# Altium project OmniCore_SDR.PrjPcb (part 2 of 3)

## Sheet JTAG.SchDoc
size A4; SheetNumber: 6; SheetTotal: 11
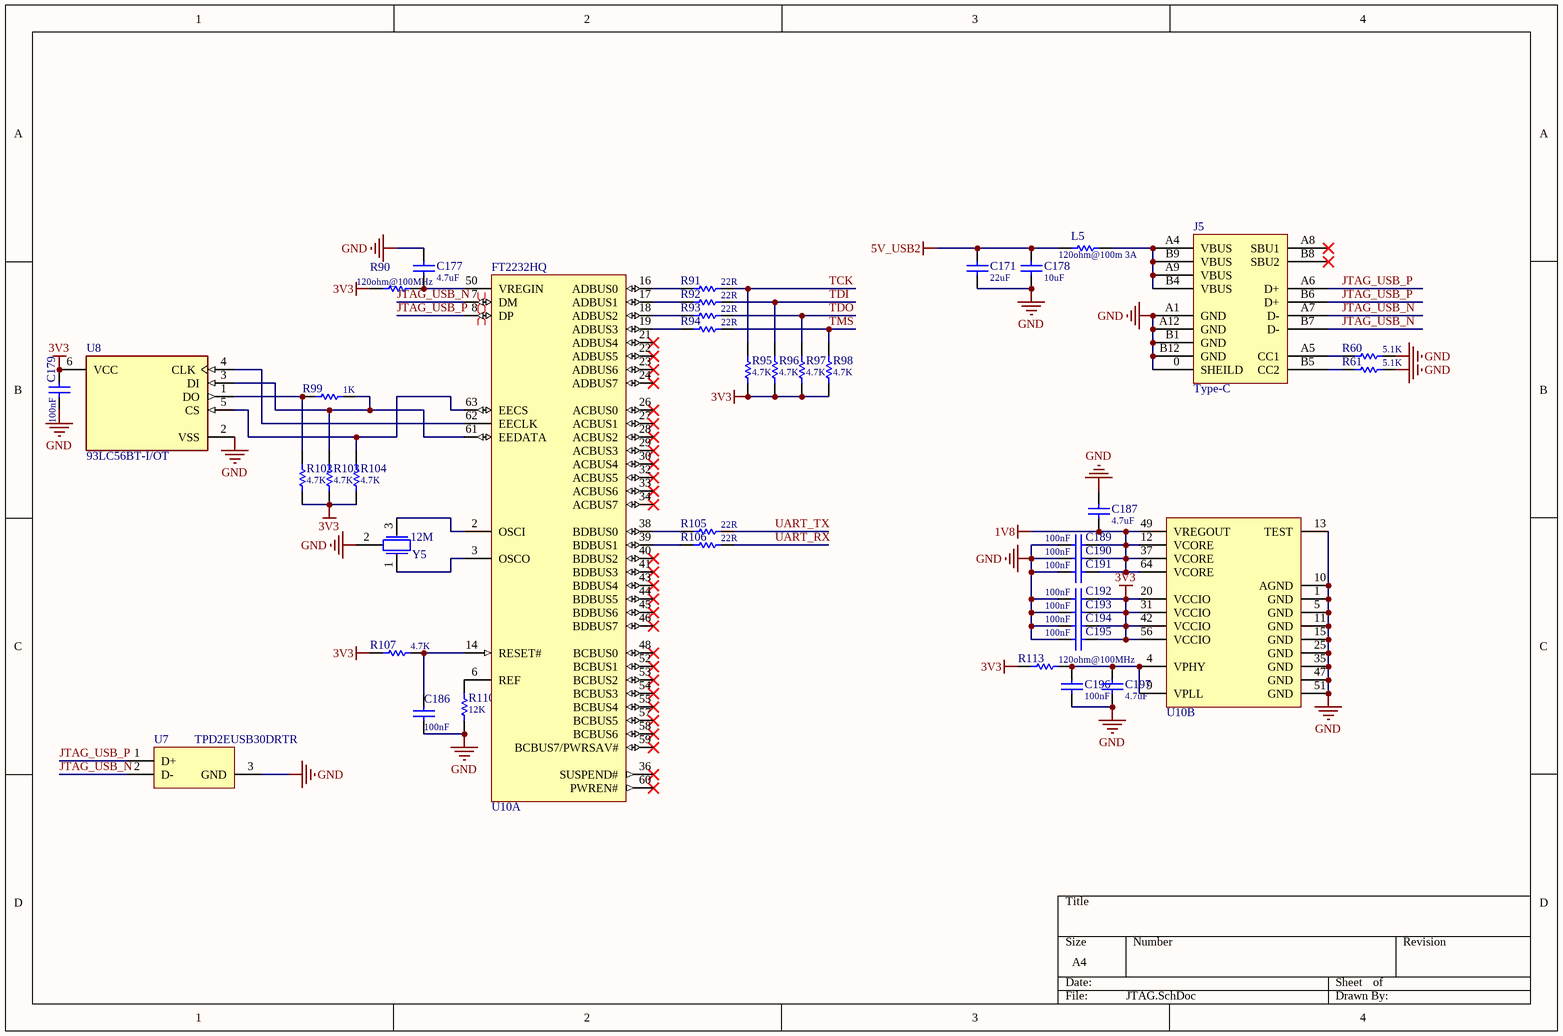
[diagram p5: JTAG.SchDoc]

### Parts
C171  value 22uF  [C0805-L]  (hidden comment: Cap-S)
C177  value 4.7uF  [C0402-L]  (hidden comment: Cap-S)
C178  value 10uF  [C0603-L]  (hidden comment: Cap-S)
C179  value 100nF  [C0402-L]  (hidden comment: Cap-S)
C186  value 100nF  [C0402-L]  (hidden comment: Cap-S)
C187  value 4.7uF  [C0402-L]  (hidden comment: Cap-S)
C189  value 100nF  [C0402-L]  (hidden comment: Cap-S)
C190  value 100nF  [C0402-L]  (hidden comment: Cap-S)
C191  value 100nF  [C0402-L]  (hidden comment: Cap-S)
C192  value 100nF  [C0402-L]  (hidden comment: Cap-S)
C193  value 100nF  [C0402-L]  (hidden comment: Cap-S)
C194  value 100nF  [C0402-L]  (hidden comment: Cap-S)
C195  value 100nF  [C0402-L]  (hidden comment: Cap-S)
C196  value 100nF  [C0402-L]  (hidden comment: Cap-S)
C197  value 4.7uF  [C0402-L]  (hidden comment: Cap-S)
J5  Type-C  [TYPE-C]
L5  value 120ohm@100m 3A  [R0805-L]  (hidden comment: R)
R60  value 5.1K  [R0402-L]  (hidden comment: R)
R61  value 5.1K  [R0402-L]  (hidden comment: R)
R90  value 120ohm@100MHz  [R0402-L]  (hidden comment: R)
R91  value 22R  [R0402-L]  (hidden comment: R)
R92  value 22R  [R0402-L]  (hidden comment: R)
R93  value 22R  [R0402-L]  (hidden comment: R)
R94  value 22R  [R0402-L]  (hidden comment: R)
R95  value 4.7K  [R0402-L]  (hidden comment: R)
R96  value 4.7K  [R0402-L]  (hidden comment: R)
R97  value 4.7K  [R0402-L]  (hidden comment: R)
R98  value 4.7K  [R0402-L]  (hidden comment: R)
R99  value 1K  [R0402-L]  (hidden comment: R)
R102  value 4.7K  [R0402-L]  (hidden comment: R)
R103  value 4.7K  [R0402-L]  (hidden comment: R)
R104  value 4.7K  [R0402-L]  (hidden comment: R)
R105  value 22R  [R0402-L]  (hidden comment: R)
R106  value 22R  [R0402-L]  (hidden comment: R)
R107  value 4.7K  [R0402-L]  (hidden comment: R)
R110  value 12K  [R0402-L]  (hidden comment: R)
R113  value 120ohm@100MHz  [R0402-L]  (hidden comment: R)
U7  TPD2EUSB30DRTR  [DRT0003A]
U8  93LC56BT-I/OT  [FP-C04-028-MFG]
U10  FT2232HQ  [QFN50P900X900X90-65N-D]  (parts A,B of 2)
Y5  12M  [XTAL-3Pin]

### Nets
1V8: C187.2 C189.2 C190.2 C191.2 U10.12(VCORE) U10.37(VCORE) U10.49(VREGOUT) U10.64(VCORE)
3V3: C179.2 C192.2 C193.2 C194.2 C195.2 R90.2 R95.2 R96.2 R97.2 R98.2 R102.2 R103.2 R104.2 R107.2 R113.2 U8.6(VCC) U10.20(VCCIO) U10.31(VCCIO) U10.42(VCCIO) U10.56(VCCIO)
5V_USB2: C171.1 C178.1 L5.1
GND: C171.2 C177.1 C178.2 C179.1 C186.1 C187.1 C189.1 C190.1 C191.1 C192.1 C193.1 C194.1 C195.1 C196.1 C197.2 J5.0(SHEILD) J5.A1(GND) J5.A12(GND) J5.B1(GND) J5.B12(GND) R60.1 R61.1 R110.1 U7.3(GND) U8.2(VSS) U10.1(GND) U10.5(GND) U10.10(AGND) U10.11(GND) U10.13(TEST) U10.15(GND) U10.25(GND) U10.35(GND) U10.47(GND) U10.51(GND) Y5.2
JTAG_USB_N: J5.A7(D-) J5.B7(D-) U7.2(D-) U10.7(DM)
JTAG_USB_P: J5.A6(D+) J5.B6(D+) U7.1(D+) U10.8(DP)
TCK: R91.1 R95.1
TDI: R92.1 R96.1
TDO: R93.1 R97.1
TMS: R94.1 R98.1
UART_RX: R106.1
UART_TX: R105.1
NetC177_2: C177.2 R90.1 U10.50(VREGIN)
NetC186_2: C186.2 R107.1 U10.14(RESET#)
NetC196_2: C196.2 C197.1 R113.1 U10.4(VPHY) U10.9(VPLL)
NetJ5_A4: J5.A4(VBUS) J5.A9(VBUS) J5.B4(VBUS) J5.B9(VBUS) L5.2
NetJ5_A5: J5.A5(CC1) R60.2
NetJ5_B5: J5.B5(CC2) R61.2
NetR91_2: R91.2 U10.16(ADBUS0)
NetR92_2: R92.2 U10.17(ADBUS1)
NetR93_2: R93.2 U10.18(ADBUS2)
NetR94_2: R94.2 U10.19(ADBUS3)
NetR99_1: R99.1 R103.1 U8.3(DI) U10.61(EEDATA)
NetR99_2: R99.2 R102.1 U8.1(DO)
NetR104_1: R104.1 U8.5(CS) U10.63(EECS)
NetR105_2: R105.2 U10.38(BDBUS0)
NetR106_2: R106.2 U10.39(BDBUS1)
NetR110_2: R110.2 U10.6(REF)
NetU8_4: U8.4(CLK) U10.62(EECLK)
NetU10_2: U10.2(OSCI) Y5.3
NetU10_3: U10.3(OSCO) Y5.1

Not connected (* = marked no-connect by the designer): J5 A8(SBU1)* B8(SBU2)*; U10 21(ADBUS4)* 22(ADBUS5)* 23(ADBUS6)* 24(ADBUS7)* 26(ACBUS0)* 27(ACBUS1)* 28(ACBUS2)* 29(ACBUS3)* 30(ACBUS4)* 32(ACBUS5)* 33(ACBUS6)* 34(ACBUS7)* 36(SUSPEND#)* 40(BDBUS2)* 41(BDBUS3)* 43(BDBUS4)* 44(BDBUS5)* 45(BDBUS6)* 46(BDBUS7)* 48(BCBUS0)* 52(BCBUS1)* 53(BCBUS2)* 54(BCBUS3)* 55(BCBUS4)* 57(BCBUS5)* 58(BCBUS6)* 59(BCBUS7/PWRSAV#)* 60(PWREN#)*

### Layout directives
differential pair: JTAG_USB_N, JTAG_USB_P

### Library data of the parts
C171 C177-C179 C186 C187 C189-C197 = Cap-S: 贴片瓷片电容
L5 R60 R61 R90-R99 R102-R107 R110 R113 = Res: 贴片电阻
U7 = CMP-0326-00046-3: ESD Solution for Super-Speed (6 Gbps) USB 3.0 Interface, 2 Channels, -40 to +85 degC, 3-pin SOT (DRT), Green (Rohs & No Sb/Br); Manufacturer: Texas Instruments; Differential Capacitance(pF): 0.01; Breakdown Voltage(Min)(V): 9; HDMI: TRUE; IEC 61000-4-2 Air-Gap(+/- kV): 8; IO Leakage Current(nA): 10; IO Capacitance(Typ)(pF): 0.7; Mounting Technology: Surface Mount; PackageDescription: 3-Flat Lead Plastic Small Outline, 1 x 1 mm (inc leads), 0.35 mm Pitch; IEC 61000-4-2 Contact(+/- kV): 8; USB Super Speed: TRUE; Eco-Plan: Green (RoHS & no Sb/Br); USB High Speed: TRUE; PackageReference: DRT0003A; SubFamily: ESD Solution; USB Full Speed: TRUE; ComponentLink1Description: Datasheet; ComponentLink2URL: SamplesURL:http://www.ti.com/product/tpd2eusb30#samples; PackageVersion: revD, Jun-2008; ComponentLink2Description: URL Link1; 1394 / Firewire: TRUE; PartNumber: TPD2EUSB30DRTR; ComponentLink1URL: http://www.ti.com/general/docs/lit/getliterature.tsp?genericPartNumber=TPD2EUSB30&fileType=pdf; DatasheetVersion: SLVSAC2C; Serial ATA / eSATA: TRUE
U8 = CMP-0162-00356-2: IC EEPROM 2K SPI 2MHZ SOT23-6; Access Time: 250ns; Density: 2Kb; Max Supply Voltage: 5.5V; Interface: Serial; Min Supply Voltage: 2.5V; Nominal Supply Current: 2mA; Number of Pins: 6; Radiation Hardening: No; Length: 3.1mm; Height: 1.3mm; Min Operating Temperature: -40°C; Max Operating Temperature: 85°C; Lead Free: Lead Free; Memory Type: EEPROM; Contact Plating: Tin; REACH SVHC: No SVHC; Package Quantity: 3000; Frequency: 2MHz; Width: 1.8mm; Max Frequency: 2MHz; Case/Package: SOT-23; Mount: Surface Mount; Packaging: Tape and Reel; Memory Size: 2Kb
U10 = FT2232HQ: Dual High Speed USB to Multipurpose UART / FIFO IC / , 3 to 3.6 V, -40 to 85 degC, 64- Pin LQFP, RoHS; Manufacturer: FTDI; Number of Channels per Chip: 2; Standard Supported: RS232,RS422,RS485; Maximum Data Rate: 480Mbit/s; Package Description: 64-Pin Low-profile Quad Flat Package, Body 10 x 10 mm, Pitch 0.5 mm; Maximum Operating Temperature: +85°C; Mounting Technology: SurfaceMount; Pin Count: 64; Package Reference: LQFP-64; Manufacturer URL: http://www.nxp.com/; Length: 10mm; Width: 10mm; Minimum Operating Temperature: -40°C; Dimensions: 10x10x1.4mm; Package Type: LQFP; Mounting Type: SurfaceMount; Datasheet URL: http://www.ftdichip.com/Support/Documents/DataSheets/ICs/DS_FT2232H.pdf; Datasheet Version: Rev. 2.5, 07/2016; Height: 1.4mm
Y5 = XTAL-3PIN: 贴片晶振

## Sheet AD9361.SchDoc
size A4; SheetNumber: 7; SheetTotal: 11
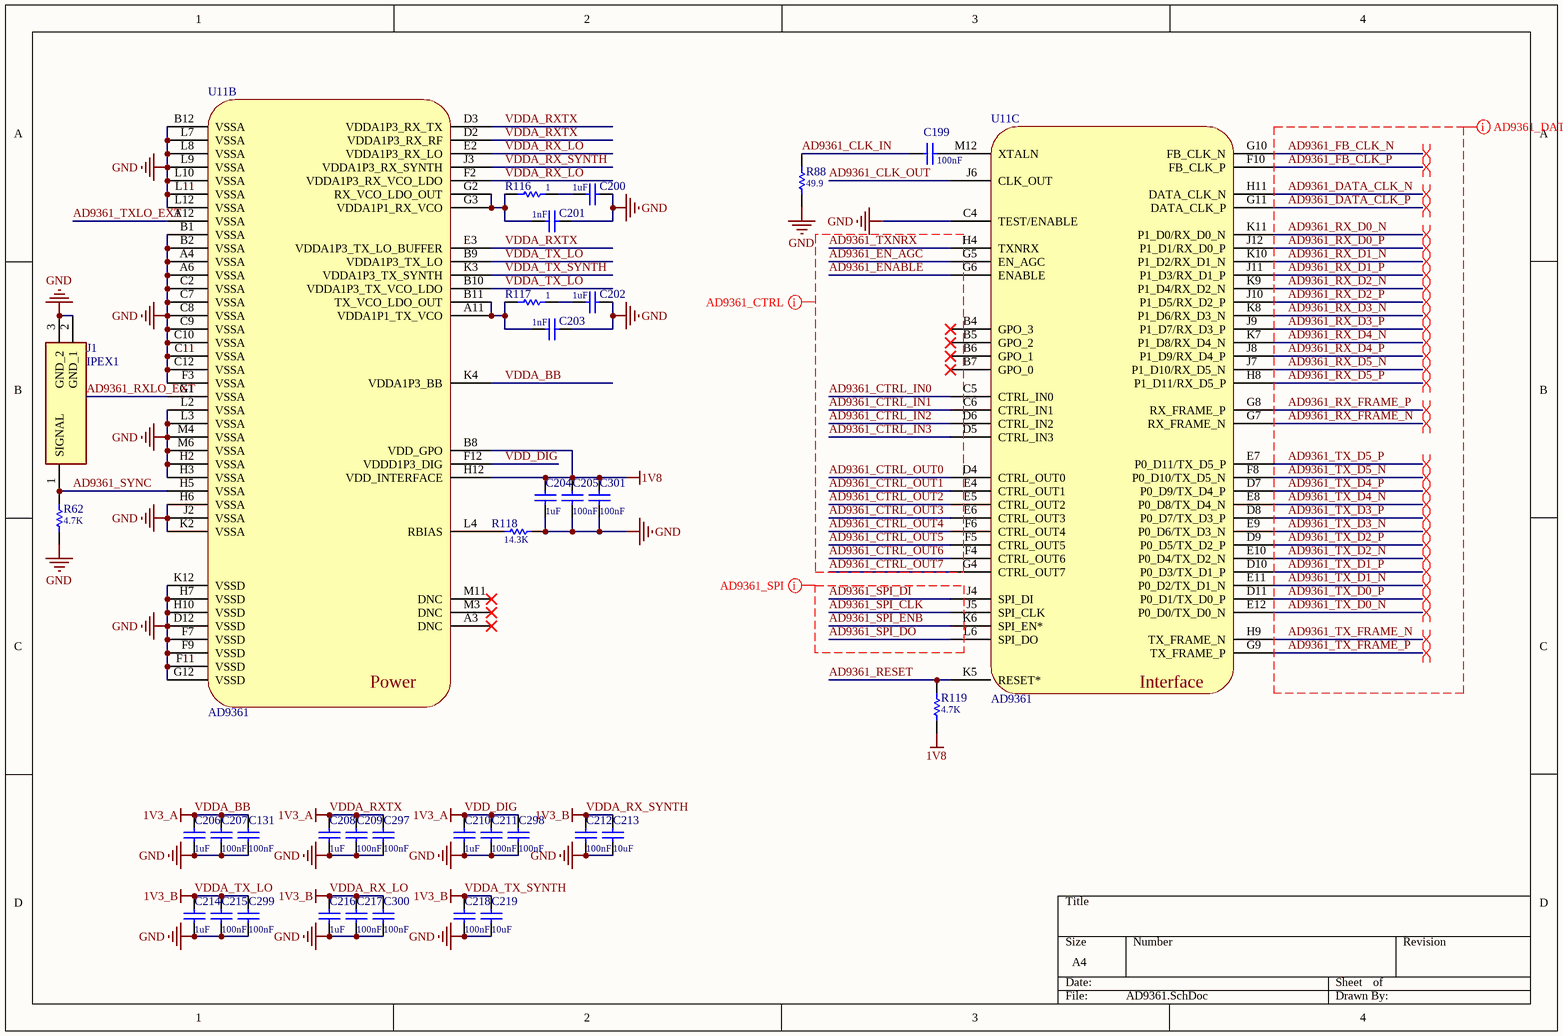
[diagram p6: AD9361.SchDoc]

### Parts
C131  value 100nF  [C0402-L]  (hidden comment: Cap-S)
C199  value 100nF  [C0402-L]  (hidden comment: Cap-S)
C200  value 1uF  [C0402-L]  (hidden comment: Cap-S)
C201  value 1nF  [C0402-L]  (hidden comment: Cap-S)
C202  value 1uF  [C0402-L]  (hidden comment: Cap-S)
C203  value 1nF  [C0402-L]  (hidden comment: Cap-S)
C204  value 1uF  [C0402-L]  (hidden comment: Cap-S)
C205  value 100nF  [C0402-L]  (hidden comment: Cap-S)
C206  value 1uF  [C0402-L]  (hidden comment: Cap-S)
C207  value 100nF  [C0402-L]  (hidden comment: Cap-S)
C208  value 1uF  [C0402-L]  (hidden comment: Cap-S)
C209  value 100nF  [C0402-L]  (hidden comment: Cap-S)
C210  value 1uF  [C0402-L]  (hidden comment: Cap-S)
C211  value 100nF  [C0402-L]  (hidden comment: Cap-S)
C212  value 100nF  [C0402-L]  (hidden comment: Cap-S)
C213  value 10uF  [C0603-L]  (hidden comment: Cap-S)
C214  value 1uF  [C0402-L]  (hidden comment: Cap-S)
C215  value 100nF  [C0402-L]  (hidden comment: Cap-S)
C216  value 1uF  [C0402-L]  (hidden comment: Cap-S)
C217  value 100nF  [C0402-L]  (hidden comment: Cap-S)
C218  value 100nF  [C0402-L]  (hidden comment: Cap-S)
C219  value 10uF  [C0603-L]  (hidden comment: Cap-S)
C297  value 100nF  [C0402-L]  (hidden comment: Cap-S)
C298  value 100nF  [C0402-L]  (hidden comment: Cap-S)
C299  value 100nF  [C0402-L]  (hidden comment: Cap-S)
C300  value 100nF  [C0402-L]  (hidden comment: Cap-S)
C301  value 100nF  [C0402-L]  (hidden comment: Cap-S)
J1  IPEX1  [20279-001E]
R62  value 4.7K  [R0402-L]  (hidden comment: R)
R88  value 49.9  [R0402-L]  (hidden comment: R)
R116  value 1  [R0402-L]  (hidden comment: R)
R117  value 1  [R0402-L]  (hidden comment: R)
R118  value 14.3K  [R0402-L]  (hidden comment: R)
R119  value 4.7K  [R0402-L]  (hidden comment: R)
U11  AD9361  [BGA144C80P12X12_1000X1000X170]  (parts B,C of 3)

### Nets
1V8: C204.2 C205.2 C301.2 R119.2 U11.B8(VDD_GPO) U11.H12(VDD_INTERFACE)
GND: C131.1 C200.1 C201.1 C202.1 C203.1 C204.1 C205.1 C206.1 C207.1 C208.1 C209.1 C210.1 C211.1 C212.1 C213.1 C214.1 C215.1 C216.1 C217.1 C218.1 C219.1 C297.1 C298.1 C299.1 C300.1 C301.1 J1.2(GND_1) J1.3(GND_2) R62.2 R88.1 R118.2 U11.A4(VSSA) U11.A6(VSSA) U11.B1(VSSA) U11.B2(VSSA) U11.B12(VSSA) U11.C2(VSSA) U11.C4(TEST/ENABLE) U11.C7(VSSA) U11.C8(VSSA) U11.C9(VSSA) U11.C10(VSSA) U11.C11(VSSA) U11.C12(VSSA) U11.D12(VSSD) U11.F3(VSSA) U11.F7(VSSD) U11.F9(VSSD) U11.F11(VSSD) U11.G12(VSSD) U11.H2(VSSA) U11.H3(VSSA) U11.H6(VSSA) U11.H7(VSSD) U11.H10(VSSD) U11.J2(VSSA) U11.K2(VSSA) U11.K12(VSSD) U11.L2(VSSA) U11.L3(VSSA) U11.L7(VSSA) U11.L8(VSSA) U11.L9(VSSA) U11.L10(VSSA) U11.L11(VSSA) U11.L12(VSSA) U11.M4(VSSA) U11.M6(VSSA)
VDD_DIG: C131.2 C206.2 C207.2 C208.2 C209.2 C210.2 C211.2 C297.2 C298.2 U11.D2(VDDA1P3_RX_RF) U11.D3(VDDA1P3_RX_TX) U11.E3(VDDA1P3_TX_LO_BUFFER) U11.F12(VDDD1P3_DIG) U11.K4(VDDA1P3_BB)  [also labelled 1V3_A, VDDA_BB, VDDA_RXTX]
VDDA_RX_LO: C212.2 C213.2 C214.2 C215.2 C216.2 C217.2 C218.2 C219.2 C299.2 C300.2 U11.B9(VDDA1P3_TX_LO) U11.B10(VDDA1P3_TX_VCO_LDO) U11.E2(VDDA1P3_RX_LO) U11.F2(VDDA1P3_RX_VCO_LDO) U11.J3(VDDA1P3_RX_SYNTH) U11.K3(VDDA1P3_TX_SYNTH)  [also labelled 1V3_B, VDDA_RX_SYNTH, VDDA_TX_LO, VDDA_TX_SYNTH]
AD9361_CLK_IN: C199.2 R88.2
AD9361_CLK_OUT: U11.J6(CLK_OUT)
AD9361_CTRL_IN0: U11.C5(CTRL_IN0)
AD9361_CTRL_IN1: U11.C6(CTRL_IN1)
AD9361_CTRL_IN2: U11.D6(CTRL_IN2)
AD9361_CTRL_IN3: U11.D5(CTRL_IN3)
AD9361_CTRL_OUT0: U11.D4(CTRL_OUT0)
AD9361_CTRL_OUT1: U11.E4(CTRL_OUT1)
AD9361_CTRL_OUT2: U11.E5(CTRL_OUT2)
AD9361_CTRL_OUT3: U11.E6(CTRL_OUT3)
AD9361_CTRL_OUT4: U11.F6(CTRL_OUT4)
AD9361_CTRL_OUT5: U11.F5(CTRL_OUT5)
AD9361_CTRL_OUT6: U11.F4(CTRL_OUT6)
AD9361_CTRL_OUT7: U11.G4(CTRL_OUT7)
AD9361_DATA_CLK_N: U11.H11(DATA_CLK_N)
AD9361_DATA_CLK_P: U11.G11(DATA_CLK_P)
AD9361_EN_AGC: U11.G5(EN_AGC)
AD9361_ENABLE: U11.G6(ENABLE)
AD9361_FB_CLK_N: U11.G10(FB_CLK_N)
AD9361_FB_CLK_P: U11.F10(FB_CLK_P)
AD9361_RESET: R119.1 U11.K5(RESET*)
AD9361_RX_D0_N: U11.K11(P1_D0/RX_D0_N)
AD9361_RX_D0_P: U11.J12(P1_D1/RX_D0_P)
AD9361_RX_D1_N: U11.K10(P1_D2/RX_D1_N)
AD9361_RX_D1_P: U11.J11(P1_D3/RX_D1_P)
AD9361_RX_D2_N: U11.K9(P1_D4/RX_D2_N)
AD9361_RX_D2_P: U11.J10(P1_D5/RX_D2_P)
AD9361_RX_D3_N: U11.K8(P1_D6/RX_D3_N)
AD9361_RX_D3_P: U11.J9(P1_D7/RX_D3_P)
AD9361_RX_D4_N: U11.K7(P1_D8/RX_D4_N)
AD9361_RX_D4_P: U11.J8(P1_D9/RX_D4_P)
AD9361_RX_D5_N: U11.J7(P1_D10/RX_D5_N)
AD9361_RX_D5_P: U11.H8(P1_D11/RX_D5_P)
AD9361_RX_FRAME_N: U11.G7(RX_FRAME_N)
AD9361_RX_FRAME_P: U11.G8(RX_FRAME_P)
AD9361_RXLO_EXT: U11.G1(VSSA)
AD9361_SPI_CLK: U11.J5(SPI_CLK)
AD9361_SPI_DI: U11.J4(SPI_DI)
AD9361_SPI_DO: U11.L6(SPI_DO)
AD9361_SPI_ENB: U11.K6(SPI_EN*)
AD9361_SYNC: J1.1(SIGNAL) R62.1 U11.H5(VSSA)
AD9361_TX_D0_N: U11.E12(P0_D0/TX_D0_N)
AD9361_TX_D0_P: U11.D11(P0_D1/TX_D0_P)
AD9361_TX_D1_N: U11.E11(P0_D2/TX_D1_N)
AD9361_TX_D1_P: U11.D10(P0_D3/TX_D1_P)
AD9361_TX_D2_N: U11.E10(P0_D4/TX_D2_N)
AD9361_TX_D2_P: U11.D9(P0_D5/TX_D2_P)
AD9361_TX_D3_N: U11.E9(P0_D6/TX_D3_N)
AD9361_TX_D3_P: U11.D8(P0_D7/TX_D3_P)
AD9361_TX_D4_N: U11.E8(P0_D8/TX_D4_N)
AD9361_TX_D4_P: U11.D7(P0_D9/TX_D4_P)
AD9361_TX_D5_N: U11.F8(P0_D10/TX_D5_N)
AD9361_TX_D5_P: U11.E7(P0_D11/TX_D5_P)
AD9361_TX_FRAME_N: U11.H9(TX_FRAME_N)
AD9361_TX_FRAME_P: U11.G9(TX_FRAME_P)
AD9361_TXLO_EXT: U11.A12(VSSA)
AD9361_TXNRX: U11.H4(TXNRX)
NetC199_1: C199.1 U11.M12(XTALN)
NetC200_2: C200.2 R116.2
NetC201_2: C201.2 R116.1 U11.G2(RX_VCO_LDO_OUT) U11.G3(VDDA1P1_RX_VCO)
NetC202_2: C202.2 R117.2
NetC203_2: C203.2 R117.1 U11.A11(VDDA1P1_TX_VCO) U11.B11(TX_VCO_LDO_OUT)
NetR118_1: R118.1 U11.L4(RBIAS)

Not connected (* = marked no-connect by the designer): U11 A3(DNC)* B4(GPO_3)* B5(GPO_2)* B6(GPO_1)* B7(GPO_0)* M3(DNC)* M11(DNC)*

### Layout directives
differential pair: AD9361_DATA_CLK_N, AD9361_DATA_CLK_P, AD9361_FB_CLK_N, AD9361_FB_CLK_P, AD9361_RX_D0_N, AD9361_RX_D0_P, AD9361_RX_D1_N, AD9361_RX_D1_P, AD9361_RX_D2_N, AD9361_RX_D2_P, AD9361_RX_D3_N, AD9361_RX_D3_P, AD9361_RX_D4_N, AD9361_RX_D4_P, AD9361_RX_D5_N, AD9361_RX_D5_P, AD9361_RX_FRAME_N, AD9361_RX_FRAME_P, AD9361_TX_D0_N, AD9361_TX_D0_P, AD9361_TX_D1_N, AD9361_TX_D1_P, AD9361_TX_D2_N, AD9361_TX_D2_P, AD9361_TX_D3_N, AD9361_TX_D3_P, AD9361_TX_D4_N, AD9361_TX_D4_P, AD9361_TX_D5_N, AD9361_TX_D5_P, AD9361_TX_FRAME_N, AD9361_TX_FRAME_P
net class AD9361_DATA: AD9361_DATA_CLK_N, AD9361_DATA_CLK_P, AD9361_FB_CLK_N, AD9361_FB_CLK_P, AD9361_RX_D0_N, AD9361_RX_D0_P, AD9361_RX_D1_N, AD9361_RX_D1_P, AD9361_RX_D2_N, AD9361_RX_D2_P, AD9361_RX_D3_N, AD9361_RX_D3_P, AD9361_RX_D4_N, AD9361_RX_D4_P, AD9361_RX_D5_N, AD9361_RX_D5_P, AD9361_RX_FRAME_N, AD9361_RX_FRAME_P, AD9361_TX_D0_N, AD9361_TX_D0_P, AD9361_TX_D1_N, AD9361_TX_D1_P, AD9361_TX_D2_N, AD9361_TX_D2_P, AD9361_TX_D3_N, AD9361_TX_D3_P, AD9361_TX_D4_N, AD9361_TX_D4_P, AD9361_TX_D5_N, AD9361_TX_D5_P, AD9361_TX_FRAME_N, AD9361_TX_FRAME_P
net class AD9361_SPI: AD9361_SPI_CLK, AD9361_SPI_DI, AD9361_SPI_DO, AD9361_SPI_ENB
net class AD9361_CTRL: AD9361_CTRL_IN0, AD9361_CTRL_IN1, AD9361_CTRL_IN2, AD9361_CTRL_IN3, AD9361_CTRL_OUT0, AD9361_CTRL_OUT1, AD9361_CTRL_OUT2, AD9361_CTRL_OUT3, AD9361_CTRL_OUT4, AD9361_CTRL_OUT5, AD9361_CTRL_OUT6, AD9361_CTRL_OUT7, AD9361_EN_AGC, AD9361_ENABLE, AD9361_TXNRX

### Notes on the sheet
- (in symbol AD9361, part B) Power
- (in symbol AD9361, part C) Interface

### Library data of the parts
C131 C199-C219 C297-C301 = Cap-S: 贴片瓷片电容
J1 = IPEX4
R62 R88 R116-R119 = Res: 贴片电阻
U11 = AD9361: 70M-6G射频收发器

## Sheet AD9361_RF.SchDoc
size A4; SheetNumber: 8; SheetTotal: 11
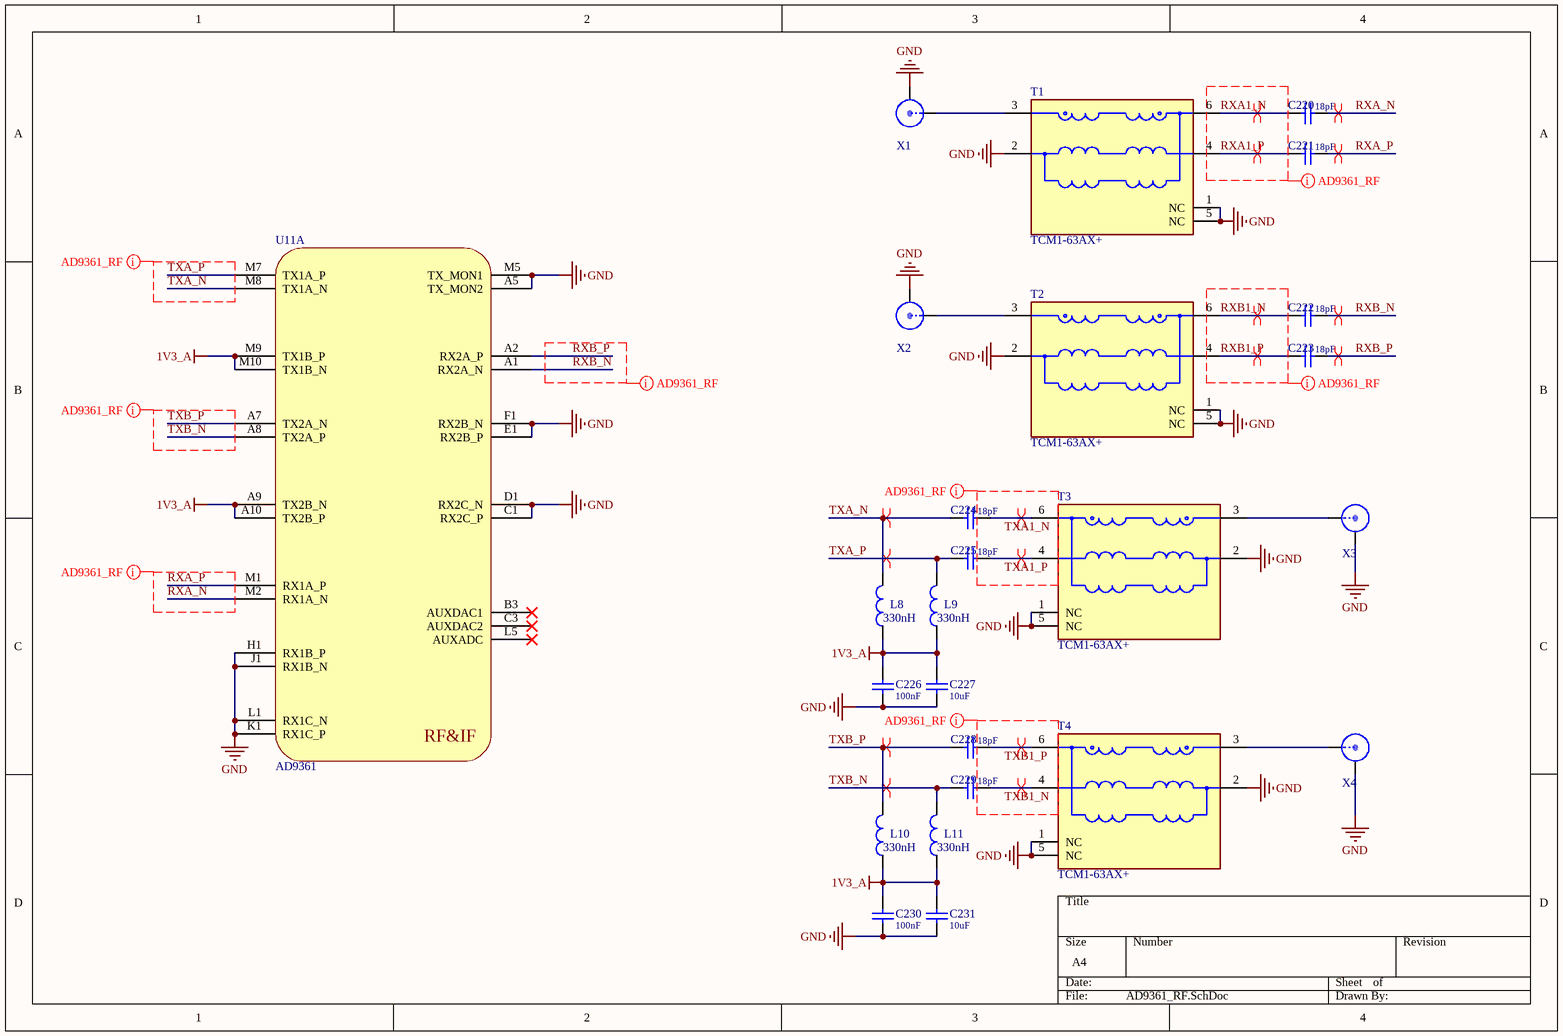
[diagram p7: AD9361_RF.SchDoc]

### Parts
C220  value 18pF  [C0201]  (hidden comment: Cap-S)
C221  value 18pF  [C0201]  (hidden comment: Cap-S)
C222  value 18pF  [C0201]  (hidden comment: Cap-S)
C223  value 18pF  [C0201]  (hidden comment: Cap-S)
C224  value 18pF  [C0201]  (hidden comment: Cap-S)
C225  value 18pF  [C0201]  (hidden comment: Cap-S)
C226  value 100nF  [C0603-L]  (hidden comment: Cap-S)
C227  value 10uF  [C0603-L]  (hidden comment: Cap-S)
C228  value 18pF  [C0201]  (hidden comment: Cap-S)
C229  value 18pF  [C0201]  (hidden comment: Cap-S)
C230  value 100nF  [C0603-L]  (hidden comment: Cap-S)
C231  value 10uF  [C0603-L]  (hidden comment: Cap-S)
L8  330nH  [L0603]
L9  330nH  [L0603]
L10  330nH  [L0603]
L11  330nH  [L0603]
T1  TCM1-63AX+  [FP-TCM1-63AX+-MFG]
T2  TCM1-63AX+  [FP-TCM1-63AX+-MFG]
T3  TCM1-63AX+  [FP-TCM1-63AX+-MFG]
T4  TCM1-63AX+  [FP-TCM1-63AX+-MFG]
U11  AD9361  [BGA144C80P12X12_1000X1000X170]  (part A of 3)
X1  SMA  [SMA_ANGLE]  (value not drawn)
X2  SMA  [SMA_ANGLE]  (value not drawn)
X3  SMA  [SMA_ANGLE]  (value not drawn)
X4  SMA  [SMA_ANGLE]  (value not drawn)

### Nets
1V3_A: C226.1 C227.1 C230.1 C231.1 L8.1 L9.1 L10.1 L11.1 U11.A9(TX2B_N) U11.A10(TX2B_P) U11.M9(TX1B_P) U11.M10(TX1B_N)  [project net VDD_DIG]
GND: C226.2 C227.2 C230.2 C231.2 T1.1(NC) T1.2(GND) T1.5(NC) T2.1(NC) T2.2(GND) T2.5(NC) T3.1(NC) T3.2(GND) T3.5(NC) T4.1(NC) T4.2(GND) T4.5(NC) U11.A5(TX_MON2) U11.C1(RX2C_P) U11.D1(RX2C_N) U11.E1(RX2B_P) U11.F1(RX2B_N) U11.H1(RX1B_P) U11.J1(RX1B_N) U11.K1(RX1C_P) U11.L1(RX1C_N) U11.M5(TX_MON1) X1.2 X2.2 X3.2 X4.2
RXA1_N: C220.2 T1.6(SECONDARY_DOT)
RXA1_P: C221.2 T1.4(SECONDARY)
RXA_N: C220.1 U11.M2(RX1A_N)
RXA_P: C221.1 U11.M1(RX1A_P)
RXB1_N: C222.2 T2.6(SECONDARY_DOT)
RXB1_P: C223.2 T2.4(SECONDARY)
RXB_N: C222.1 U11.A1(RX2A_N)
RXB_P: C223.1 U11.A2(RX2A_P)
TXA1_N: C224.1 T3.6(SECONDARY_DOT)
TXA1_P: C225.1 T3.4(SECONDARY)
TXA_N: C224.2 L8.2 U11.M8(TX1A_N)
TXA_P: C225.2 L9.2 U11.M7(TX1A_P)
TXB1_N: C229.1 T4.4(SECONDARY)
TXB1_P: C228.1 T4.6(SECONDARY_DOT)
TXB_N: C229.2 L11.2 U11.A8(TX2A_P)
TXB_P: C228.2 L10.2 U11.A7(TX2A_N)
NetT1_3: T1.3(PRIMARY_DOT) X1.1
NetT2_3: T2.3(PRIMARY_DOT) X2.1
NetT3_3: T3.3(PRIMARY_DOT) X3.1
NetT4_3: T4.3(PRIMARY_DOT) X4.1

Not connected (* = marked no-connect by the designer): U11 B3(AUXDAC1)* C3(AUXDAC2)* L5(AUXADC)*

### Layout directives
differential pair: RXA1_N, RXA1_P, RXA_N, RXA_P, RXB1_N, RXB1_P, RXB_N, RXB_P, TXA1_N, TXA1_P, TXA_N, TXA_P, TXB1_N, TXB1_P, TXB_N, TXB_P
net class AD9361_RF: RXA1_N, RXA1_P, RXA_N, RXA_P, RXB1_N, RXB1_P, RXB_N, RXB_P, TXA1_N, TXA1_P, TXA_N, TXA_P, TXB1_N, TXB1_P, TXB_N, TXB_P

### Notes on the sheet
- (in symbol AD9361, part A) RF&IF

### Library data of the parts
C220-C231 = Cap-S: 贴片瓷片电容
L8-L11 = L
T1-T4 = CMP-199822-000001-1: 1:1 CORE & WIRE Transformer, 10 - 6000 MHz, 50Ω; Manufacturer: Mini-Circuits; Insertion Loss: 1.16-1.8dB; Return Loss: 9.42-16.9dB; Lead Free: Yes; Device Class L3: unset; Temperature: -40°C to +85°C; Manufacturer Part Number: TCM1-63AX+; Frequency: 10-6000MHz; Device Class L2: Transformers; RoHS: TRUE; Octopart: https://octopart.com/tcm1-63ax%2B-mini-circuits-107315723; Temperature Range Low: -40°C; Category: Trans; Package: 0; ComponentLink2URL: https://www.minicircuits.com/pdfs/TCM1-63AX+.pdf; ComponentLink2Description: Datasheet; Automotive: No; Height: 4.06mm; Device Class L1: Passive Components; Temperature Range High: +85°C; Turns Ratio: 1:1
U11 = AD9361: 70M-6G射频收发器
X1-X4 = SMA_1

## Sheet Sys_Power.SchDoc
size A4; SheetNumber: 9; SheetTotal: 11
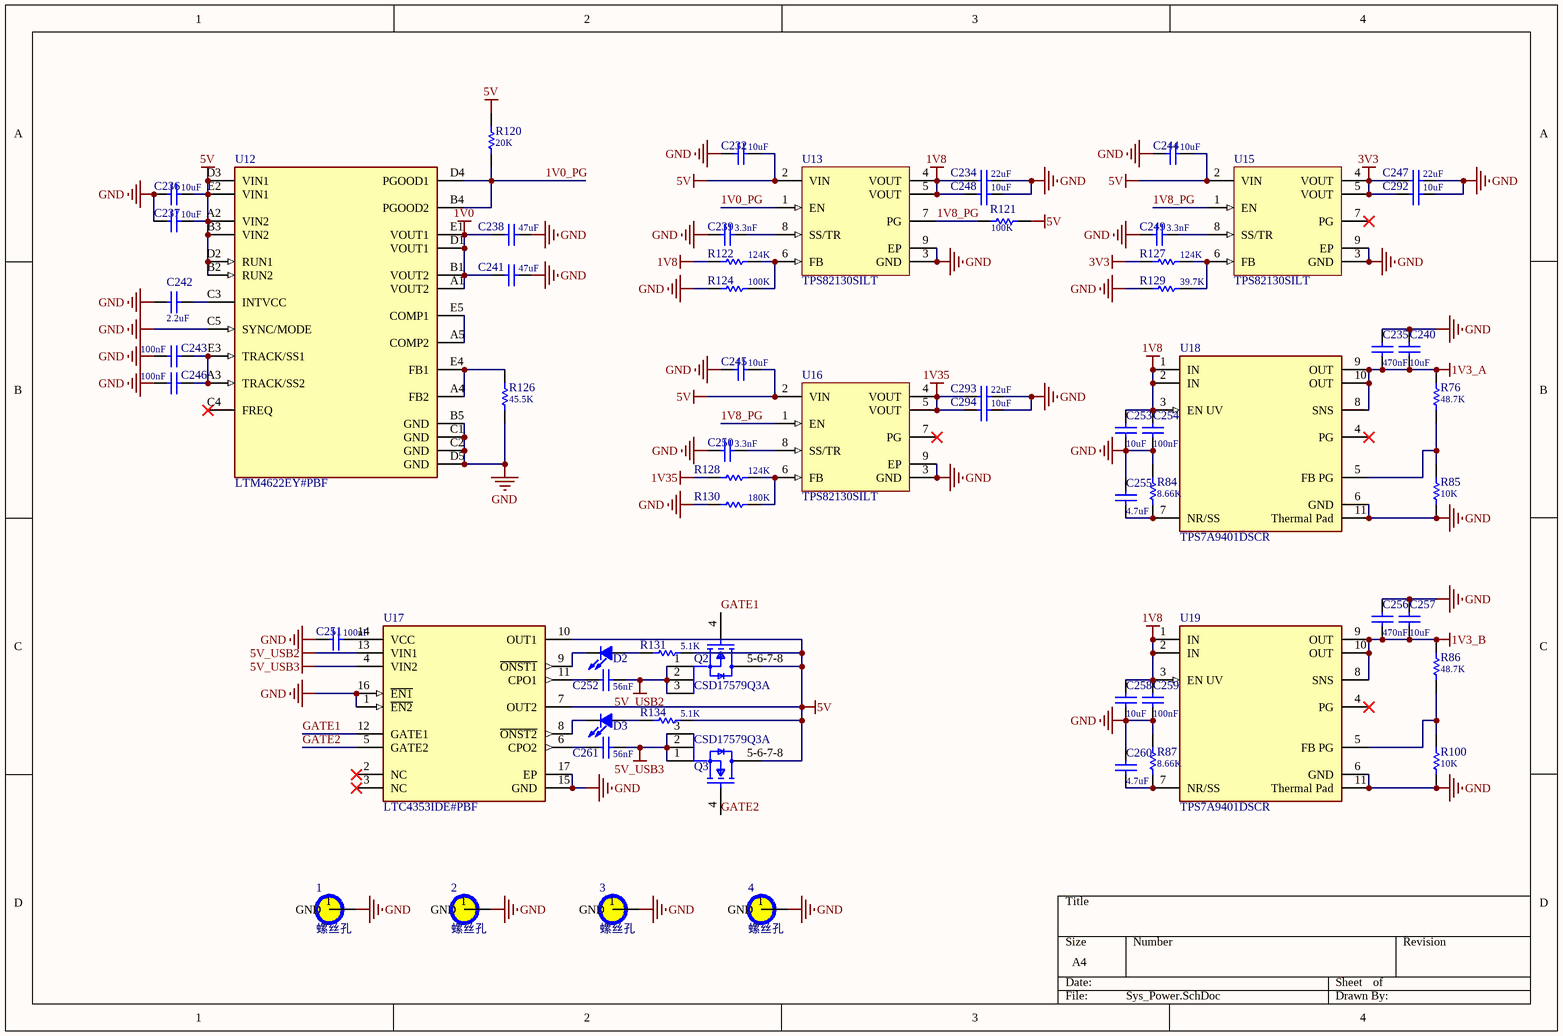
[diagram p8: Sys_Power.SchDoc]

### Parts
1  螺丝孔  [螺丝孔]
2  螺丝孔  [螺丝孔]
3  螺丝孔  [螺丝孔]
4  螺丝孔  [螺丝孔]
C232  value 10uF  [C0805-L]  (hidden comment: Cap-S)
C234  value 22uF  [C0805-L]  (hidden comment: Cap-S)
C235  value 470nF  [C0402-L]  (hidden comment: Cap-S)
C236  value 10uF  [C0805-L]  (hidden comment: Cap-S)
C237  value 10uF  [C0805-L]  (hidden comment: Cap-S)
C238  value 47uF  [C0805-L]  (hidden comment: Cap-S)
C239  value 3.3nF  [C0402-L]  (hidden comment: Cap-S)
C240  value 10uF  [C0603-L]  (hidden comment: Cap-S)
C241  value 47uF  [C0805-L]  (hidden comment: Cap-S)
C242  value 2.2uF  [C0603-L]  (hidden comment: Cap-S)
C243  value 100nF  [C0402-L]  (hidden comment: Cap-S)
C244  value 10uF  [C0805-L]  (hidden comment: Cap-S)
C245  value 10uF  [C0805-L]  (hidden comment: Cap-S)
C246  value 100nF  [C0402-L]  (hidden comment: Cap-S)
C247  value 22uF  [C0805-L]  (hidden comment: Cap-S)
C248  value 10uF  [C0603-L]  (hidden comment: Cap-S)
C249  value 3.3nF  [C0402-L]  (hidden comment: Cap-S)
C250  value 3.3nF  [C0402-L]  (hidden comment: Cap-S)
C251  value 100nF  [C0402-L]  (hidden comment: Cap-S)
C252  value 56nF  [C0402-L]  (hidden comment: Cap-S)
C253  value 10uF  [C0603-L]  (hidden comment: Cap-S)
C254  value 100nF  [C0402-L]  (hidden comment: Cap-S)
C255  value 4.7uF  [C0603-L]  (hidden comment: Cap-S)
C256  value 470nF  [C0402-L]  (hidden comment: Cap-S)
C257  value 10uF  [C0603-L]  (hidden comment: Cap-S)
C258  value 10uF  [C0603-L]  (hidden comment: Cap-S)
C259  value 100nF  [C0402-L]  (hidden comment: Cap-S)
C260  value 4.7uF  [C0603-L]  (hidden comment: Cap-S)
C261  value 56nF  [C0402-L]  (hidden comment: Cap-S)
C292  value 10uF  [C0603-L]  (hidden comment: Cap-S)
C293  value 22uF  [C0805-L]  (hidden comment: Cap-S)
C294  value 10uF  [C0603-L]  (hidden comment: Cap-S)
D2  LED  [LED_0603_L]  (value not drawn)
D3  LED  [LED_0603_L]  (value not drawn)
Q2  CSD17579Q3A  [FP-DNH0008A-MFG]
Q3  CSD17579Q3A  [FP-DNH0008A-MFG]
R76  value 48.7K  [R0402-L]  (hidden comment: R)
R84  value 8.66K  [R0402-L]  (hidden comment: R)
R85  value 10K  [R0402-L]  (hidden comment: R)
R86  value 48.7K  [R0402-L]  (hidden comment: R)
R87  value 8.66K  [R0402-L]  (hidden comment: R)
R100  value 10K  [R0402-L]  (hidden comment: R)
R120  value 20K  [R0402-L]  (hidden comment: R)
R121  value 100K  [R0402-L]  (hidden comment: R)
R122  value 124K  [R0402-L]  (hidden comment: R)
R124  value 100K  [R0402-L]  (hidden comment: R)
R126  value 45.5K  [R0402-L]  (hidden comment: R)
R127  value 124K  [R0402-L]  (hidden comment: R)
R128  value 124K  [R0402-L]  (hidden comment: R)
R129  value 39.7K  [R0402-L]  (hidden comment: R)
R130  value 180K  [R0402-L]  (hidden comment: R)
R131  value 5.1K  [R0402-L]  (hidden comment: R)
R134  value 5.1K  [R0402-L]  (hidden comment: R)
U12  LTM4622EY#PBF  [FP-BGA-25-05-08-1502-IPC_C]
U13  TPS82130SILT  [SIL0008D_V]
U15  TPS82130SILT  [SIL0008D_V]
U16  TPS82130SILT  [SIL0008D_V]
U17  LTC4353IDE#PBF  [FP-DE-16-05-08-1732-IPC_C]
U18  TPS7A9401DSCR  [FP-DSC0010J-MFG]
U19  TPS7A9401DSCR  [FP-DSC0010J-MFG]

### Nets
1V0: C238.2 C241.1 U12.A1(VOUT2) U12.B1(VOUT2) U12.D1(VOUT1) U12.E1(VOUT1)
1V3_A: C235.1 C240.1 R76.1 U18.8(SNS) U18.9(OUT) U18.10(OUT)  [project net VDD_DIG]
1V3_B: C256.1 C257.1 R86.1 U19.8(SNS) U19.9(OUT) U19.10(OUT)  [project net VDDA_RX_LO]
1V8: C234.2 C248.2 C253.2 C254.2 C258.2 C259.2 R122.2 U13.4(VOUT) U13.5(VOUT) U18.1(IN) U18.2(IN) U18.3(EN_UV) U19.1(IN) U19.2(IN) U19.3(EN_UV)
1V35: C293.2 C294.2 R128.2 U16.4(VOUT) U16.5(VOUT)
3V3: C247.2 C292.2 R127.2 U15.4(VOUT) U15.5(VOUT)
5V: C232.2 C236.2 C237.2 C244.2 C245.2 Q2.5-6-7-8(D) Q3.5-6-7-8(D) R120.2 R121.2 R131.1 R134.1 U12.A2(VIN2) U12.B2(RUN2) U12.B3(VIN2) U12.D2(RUN1) U12.D3(VIN1) U12.E2(VIN1) U13.2(VIN) U15.2(VIN) U16.2(VIN) U17.7(OUT2) U17.10(OUT1)
5V_USB2: C252.2 Q2.1(S) Q2.2(S) Q2.3(S) U17.13(VIN1)
5V_USB3: C261.2 Q3.1(S) Q3.2(S) Q3.3(S) U17.4(VIN2)
GND: 1.1(GND) 2.1(GND) 3.1(GND) 4.1(GND) C232.1 C234.1 C235.2 C236.1 C237.1 C238.1 C239.1 C240.2 C241.2 C242.2 C243.1 C244.1 C245.1 C246.1 C247.1 C248.1 C249.1 C250.1 C251.2 C253.1 C254.1 C255.1 C256.2 C257.2 C258.1 C259.1 C260.1 C292.1 C293.1 C294.1 R84.2 R85.2 R87.2 R100.2 R124.1 R126.1 R129.1 R130.1 U12.B5(GND) U12.C1(GND) U12.C2(GND) U12.C5(SYNC/MODE) U12.D5(GND) U13.3(GND) U13.9(EP) U15.3(GND) U15.9(EP) U16.3(GND) U16.9(EP) U17.1(~{EN2}) U17.15(GND) U17.16(~{EN1}) U17.17(EP) U18.6(GND) U18.11(Thermal_Pad) U19.6(GND) U19.11(Thermal_Pad)
1V0_PG: R120.1 U12.B4(PGOOD2) U12.D4(PGOOD1) U13.1(EN)
1V8_PG: R121.1 U13.7(PG) U15.1(EN) U16.1(EN)
GATE1: Q2.4(G) U17.12(GATE1)
GATE2: Q3.4(G) U17.5(GATE2)
NetC239_2: C239.2 U13.8(SS/TR)
NetC242_1: C242.1 U12.C3(INTVCC)
NetC243_2: C243.2 C246.2 U12.A3(TRACK/SS2) U12.E3(TRACK/SS1)
NetC249_2: C249.2 U15.8(SS/TR)
NetC250_2: C250.2 U16.8(SS/TR)
NetC251_1: C251.1 U17.14(VCC)
NetC252_1: C252.1 U17.11(CPO1)
NetC255_2: C255.2 R84.1 U18.7(NR/SS)
NetC260_2: C260.2 R87.1 U19.7(NR/SS)
NetC261_1: C261.1 U17.6(CPO2)
NetD2_1: D2.1 R131.2
NetD2_2: D2.2 U17.9(~{ONST1})
NetD3_1: D3.1 R134.2
NetD3_2: D3.2 U17.8(~{ONST2})
NetR76_2: R76.2 R85.1 U18.5(FB_PG)
NetR86_2: R86.2 R100.1 U19.5(FB_PG)
NetR122_1: R122.1 R124.2 U13.6(FB)
NetR126_2: R126.2 U12.A4(FB2) U12.E4(FB1)
NetR127_1: R127.1 R129.2 U15.6(FB)
NetR128_1: R128.1 R130.2 U16.6(FB)
NetU12_A5: U12.A5(COMP2) U12.E5(COMP1)

Not connected (* = marked no-connect by the designer): U12 C4(FREQ)*; U15 7(PG)*; U16 7(PG)*; U17 2(NC)* 3(NC)*; U18 4(PG)*; U19 4(PG)*

### Library data of the parts
C232 C234-C261 C292-C294 = Cap-S: 贴片瓷片电容
D2 D3 = LED: 发光二极管
Q2 Q3 = CMP-04962-000055-1: MOSFET N-CH 30V 35A 8VSON; Rise Time: 5ns; Fall Time: 1ns; Max Power Dissipation: 3.2W; Turn-On Delay Time: 2ns; Rds On Max: 10.2mR; Turn-Off Delay Time: 11ns; Gate to Source Voltage (Vgs): 20V; Continuous Drain Current (ID): 20A; Element Configuration: Single; Input Capacitance: 998pF; Packaging: Tape and Reel; Lead Free: Lead Free; Min Operating Temperature: -55°C; Number of Pins: 8; Contact Plating: Copper; Mount: Surface Mount; RoHS Compliant: Yes; Drain to Source Voltage (Vdss): 30V; Max Operating Temperature: 150°C
R76 R84-R87 R100 R120-R122 R124 R126-R131 R134 = Res: 贴片电阻
U12 = CMP-09139-000313-1: DC DC CNVRTR 0.6-5.5V 0.6-5.5V; Max Output Current: 2.5A; Output Current: 5A; Min Output Voltage: 600mV; Max Input Voltage: 20V; Min Input Voltage: 3.6V; Switching Frequency: 1MHz; Number of Outputs: 2; Max Output Voltage: 5.5V; REACH SVHC: No SVHC; Mount: Surface Mount; Number of Pins: 25; Case/Package: BGA; Packaging: Tray; RoHS Compliant: Yes; Min Operating Temperature: -40°C; Height: 0.07inch; Features: OVP; Length: 0.25inch; Max Operating Temperature: 125°C; Voltage - Output 1: 5.5V; Width: 0.25inch
U13 U15 U16 = CMP-2000-07569-1: Step-Down Converter MicroSiP(TM) Module with Integrated Inductor, 3 A, 3 to 17 V, -40 to 125 degC, 8-Pin uSiP (SIL), Tape and Reel; Manufacturer: Texas Instruments; Quiescent Current: 20uA; Output Voltage: 5V; Output Current: 3A; Max Input Voltage: 17V; Switching Frequency: 2MHz; Min Output Voltage: 900mV; Number of Outputs: 1; Min Input Voltage: 3V; Datasheet URL: http://www.ti.com/lit/ds/symlink/tps82130.pdf; Packaging: CutTape; Datasheet Version: Rev. C, 01/2017; Package Reference: SIL0008D; Case/Package: SMD/SMT; Manufacturer URL: http://www.ti.com/; Length: 0.12inch; Lead Free: LeadFree; Mount: SurfaceMount; Number of Pins: 8; Package Description: 8-Pin Single In-line Package, Body 3 x 2.8 mm, Pitch 0.65 mm; Max Output Voltage: 5V; Mounting Technology: SurfaceMount; Height: 0.06inch; Max Operating Temperature: 125degC; Width: 0.11inch; Min Operating Temperature: -40degC; Voltage - Output 1: 5V; RoHSCompliant: True; REACH SVHC: NoSVHC; Max Output Current: 3A
U17 = CMP-0479-00067-2: IC OR CTRLR LOAD SHARE 16DFN; Turn-On Delay Time: 400ns; Turn-Off Delay Time: 1us; Number of Drivers: 2; Propagation Delay: 1000ns; Max Supply Voltage: 18V; Min Supply Voltage: 3V; Number of Pins: 16; Case/Package: DFN EP; Package Quantity: 91; REACH SVHC: No SVHC; RoHS Compliant: Yes; Lead Free: Lead Free; Max Operating Temperature: 85°C; Min Operating Temperature: -40°C; Series: -; Number of Outputs: 2
U18 U19 = CMP-04917-000380-1: 1-A, ULTRA-LOW NOISE, ULTRA-HIGH

## Sheet Clock.SchDoc
size A4; SheetNumber: 10; SheetTotal: 11
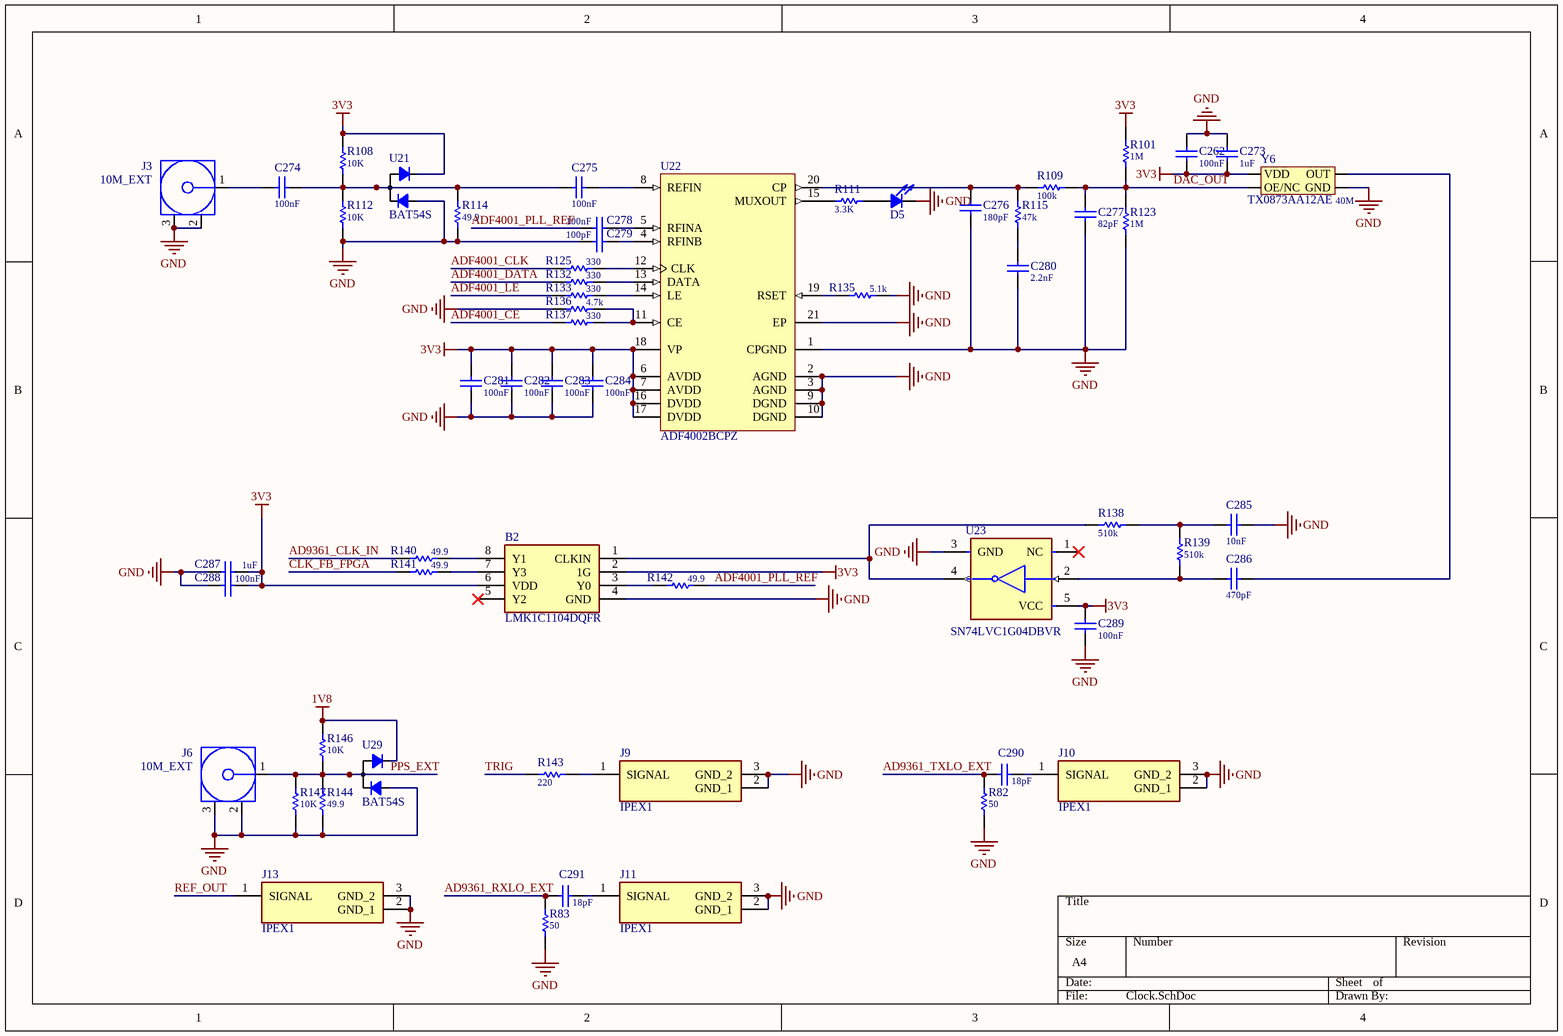
[diagram p9: Clock.SchDoc]

### Parts
B2  LMK1C1104DQFR  [SON50P200X200X80-8N]
C262  value 100nF  [C0402-L]  (hidden comment: Cap-S)
C273  value 1uF  [C0402-L]  (hidden comment: Cap-S)
C274  value 100nF  [C0402-L]  (hidden comment: Cap-S)
C275  value 100nF  [C0402-L]  (hidden comment: Cap-S)
C276  value 180pF  [C0402-L]  (hidden comment: Cap-S)
C277  value 82pF  [C0402-L]  (hidden comment: Cap-S)
C278  value 100nF  [C0402-L]  (hidden comment: Cap-S)
C279  value 100pF  [C0402-L]  (hidden comment: Cap-S)
C280  value 2.2nF  [C0402-L]  (hidden comment: Cap-S)
C281  value 100nF  [C0402-L]  (hidden comment: Cap-S)
C282  value 100nF  [C0402-L]  (hidden comment: Cap-S)
C283  value 100nF  [C0402-L]  (hidden comment: Cap-S)
C284  value 100nF  [C0402-L]  (hidden comment: Cap-S)
C285  value 10nF  [C0402-L]  (hidden comment: Cap-S)
C286  value 470pF  [C0402-L]  (hidden comment: Cap-S)
C287  value 1uF  [C0402-L]  (hidden comment: Cap-S)
C288  value 100nF  [C0402-L]  (hidden comment: Cap-S)
C289  value 100nF  [C0402-L]  (hidden comment: Cap-S)
C290  value 18pF  [C0402-L]  (hidden comment: Cap-S)
C291  value 18pF  [C0402-L]  (hidden comment: Cap-S)
D5  LED  [LED_0603_L]  (value not drawn)
J3  10M_EXT  [66012202111305]
J6  10M_EXT  [66012202111305]
J9  IPEX1  [20279-001E]
J10  IPEX1  [20279-001E]
J11  IPEX1  [20279-001E]
J13  IPEX1  [20279-001E]
R82  value 50  [R0402-L]  (hidden comment: R)
R83  value 50  [R0402-L]  (hidden comment: R)
R101  value 1M  [R0402-L]  (hidden comment: R)
R108  value 10K  [R0402-L]  (hidden comment: R)
R109  value 100k  [R0402-L]  (hidden comment: R)
R111  value 3.3K  [R0402-L]  (hidden comment: R)
R112  value 10K  [R0402-L]  (hidden comment: R)
R114  value 49.9  [R0402-L]  (hidden comment: R)
R115  value 47k  [R0402-L]  (hidden comment: R)
R123  value 1M  [R0402-L]  (hidden comment: R)
R125  value 330  [R0402-L]  (hidden comment: R)
R132  value 330  [R0402-L]  (hidden comment: R)
R133  value 330  [R0402-L]  (hidden comment: R)
R135  value 5.1k  [R0402-L]  (hidden comment: R)
R136  value 4.7k  [R0402-L]  (hidden comment: R)
R137  value 330  [R0402-L]  (hidden comment: R)
R138  value 510k  [R0402-L]  (hidden comment: R)
R139  value 510k  [R0402-L]  (hidden comment: R)
R140  value 49.9  [R0402-L]  (hidden comment: R)
R141  value 49.9  [R0402-L]  (hidden comment: R)
R142  value 49.9  [R0402-L]  (hidden comment: R)
R143  value 220  [R0402-L]  (hidden comment: R)
R144  value 49.9  [R0402-L]  (hidden comment: R)
R146  value 10K  [R0402-L]  (hidden comment: R)
R147  value 10K  [R0402-L]  (hidden comment: R)
U21  BAT54S  [SOT-23-3]
U22  ADF4002BCPZ  [ADI-CP-20-1_N]
U23  SN74LVC1G04DBVR  [FP-DBV0005A-IPC_C]
U29  BAT54S  [SOT-23-3]
Y6  TX0873AA12AE  value 40M  [XTAL-2520]

### Nets
1V8: R146.1 U29.3
3V3: B2.2(1G) B2.6(VDD) C262.1 C273.1 C281.2 C282.2 C283.2 C284.2 C287.1 C288.1 C289.1 R101.1 R108.1 U21.3 U22.6(AVDD) U22.7(AVDD) U22.16(DVDD) U22.17(DVDD) U22.18(VP) U23.5(VCC) Y6.4(VDD)
GND: B2.4(GND) C262.2 C273.2 C276.1 C277.1 C279.1 C280.1 C281.1 C282.1 C283.1 C284.1 C285.1 C287.2 C288.2 C289.2 D5.2 J3.2(GND) J3.3(GND) J6.2(GND) J6.3(GND) J9.2(GND_1) J9.3(GND_2) J10.2(GND_1) J10.3(GND_2) J11.2(GND_1) J11.3(GND_2) J13.2(GND_1) J13.3(GND_2) R82.2 R83.2 R112.2 R114.2 R123.2 R135.2 R136.1 R144.1 R147.2 U21.1 U22.1(CPGND) U22.2(AGND) U22.3(AGND) U22.9(DGND) U22.10(DGND) U22.21(EP) U23.3(GND) U29.1 Y6.2(GND)
AD9361_CLK_IN: R140.1
AD9361_RXLO_EXT: C291.2 R83.1
AD9361_TXLO_EXT: C290.2 R82.1
ADF4001_CE: R137.1
ADF4001_CLK: R125.1
ADF4001_DATA: R132.1
ADF4001_LE: R133.1
ADF4001_PLL_REF: C278.1 R142.2
CLK_FB_FPGA: R141.1
DAC_OUT: C277.2 R101.2 R109.1 R123.1 Y6.1(OE/NC)
PPS_EXT: J6.1(Signal) R144.2 R146.2 R147.1 U29.2
REF_OUT: J13.1(SIGNAL)
TRIG: R143.2
NetB2_1: B2.1(CLKIN) R138.2 U23.4(Y)
NetB2_3: B2.3(Y0) R142.1
NetB2_7: B2.7(Y3) R141.2
NetB2_8: B2.8(Y1) R140.2
NetC274_1: C274.1 J3.1(Signal)
NetC274_2: C274.2 C275.1 R108.2 R112.1 R114.1 U21.2
NetC275_2: C275.2 U22.8(REFIN)
NetC276_2: C276.2 R109.2 R115.2 U22.20(CP)
NetC278_2: C278.2 U22.5(RFINA)
NetC279_2: C279.2 U22.4(RFINB)
NetC280_2: C280.2 R115.1
NetC285_2: C285.2 R138.1 R139.1
NetC286_1: C286.1 Y6.3(OUT)
NetC286_2: C286.2 R139.2 U23.2(A)
NetC290_1: C290.1 J10.1(SIGNAL)
NetC291_1: C291.1 J11.1(SIGNAL)
NetD5_1: D5.1 R111.2
NetJ9_1: J9.1(SIGNAL) R143.1
NetR111_1: R111.1 U22.15(MUXOUT)
NetR125_2: R125.2 U22.12(CLK)
NetR132_2: R132.2 U22.13(DATA)
NetR133_2: R133.2 U22.14(LE)
NetR135_1: R135.1 U22.19(RSET)
NetR136_2: R136.2 R137.2 U22.11(CE)

Not connected (* = marked no-connect by the designer): B2 5(Y2)*; U23 1(NC)*

### Library data of the parts
B2 = LMK1C1104DQFR: Clock Buffer 4-channel output LVC MOS 1.8-V buffer; Manufacturer_Name: Texas Instruments; Geometry.Height: 0.8mm; Manufacturer_Part_Number: LMK1C1104DQFR; Mouser Part Number: 595-LMK1C1104DQFR; Mouser Price/Stock: https://www.mouser.co.uk/ProductDetail/Texas-Instruments/LMK1C1104DQFR?qs=QNEnbhJQKvYdwt0bSAj%252Blw%3D%3D; Arrow Part Number: LMK1C1104DQFR; Arrow Price/Stock: https://www.arrow.com/en/products/lmk1c1104dqfr/texas-instruments?utm_currency=USD&region=nac; Datasheet Link: https://www.ti.com/lit/ds/symlink/lmk1c1104.pdf?ts=1625794058723&ref_url=https%253A%252F%252Fwww.ti.com%252Fproduct%252FLMK1C1104
C262 C273-C291 = Cap-S: 贴片瓷片电容
D5 = LED: 发光二极管
J3 J6 = CMP-03913-103227005-2: Rf Coaxial, Mmcx Jack, 50 Ohm, Pcb Rohs Compliant: Yes; Impedance: 50Ω; Insertion Loss (dB): 0.25dB; Insulation Resistance: 1GΩ; Insulation Material: PTFE; Min Operating Temperature: -55°C; Packaging: Tape and Reel; Connector Type: MMCX; Max Operating Temperature: 155°C
J9-J11 J13 = IPEX4
R82 R83 R101 R108 R109 R111 R112 R114 R115 R123 R125 R132 R133 R135-R144 R146 R147 = Res: 贴片电阻
U22 = CMP-0287-00009-1: 200 MHz Clock Generator PLL, CP-20-1, Pb-Free, 490 Tray; Norm Phase Noise (dBc/Hz): -217dBc; Single/Dual: Single; Max REFin (MHz): 104MHz; Max RF Input (MHz): 200MHz; Frequency Range: 10MHz-200MHz; Supply Current: 4.5mA; ComponentLink2Description: Datasheet; PackageDescription: 20-Lead Lead Frame Chip Scale Package [LFCSP_VQ]; ComponentLink3Description: Package Specification; ComponentLink3URL: http://www.analog.com/static/imported-files/packages/PKG_PDF/LFCSP(CP)/CP_20_1.pdf; DatasheetVersion: REV. A; Code_JEDEC: MO-220-VGGD-1; PackageVersion: 012508-B; ComponentLink1Description: Manufacturer URL; ComponentLink1URL: www.analog.com; PackageReference: CP-20-1; ComponentLink2URL: http://www.analog.com/static/imported-files/data_sheets/ADF4001.pdf
U23 = CMP-04903-000078-1: IC INVERTER 1CH 1-INP SOT23-5; Logic Function: Buffer; Number of Bits: 1; Voltage Rating (AC): 250V; Min Supply Voltage: 1.65V; Capacitance: 22nF; Propagation Delay: 3.7ns; Tolerance: 5%; High Level Output Current: -32mA; Turn-On Delay Time: 7.5ns; Voltage Rating (DC): 400V; Output Current: 32mA; Dielectric Material: PP; Quiescent Current: 10uA; Max Supply Voltage: 5.5V; REACH SVHC: No SVHC; Case/Package: SOT-23-5; Number of Pins: 5; Min Operating Temperature: -40°C; Technology: CMOS; Number of Inputs: 1; Weight: 0.000557oz; Radiation Hardening: No; Packaging: Tape and Reel; RoHS Compliant: Yes; Package Quantity: 3000; Number of Gates: 1; Lead Free: Lead Free; Termination: PC Pins; Mount: Surface Mount; Series: 74LVC; Number of Elements: 1; Number of Circuits: 1; Max Operating Temperature: 125°C; Low Level Output Current: 32mA
Y6 = XTALS: 贴片有源晶振

## Sheet CH32H417_USB3.SchDoc
size A4; SheetNumber: 11; SheetTotal: 11
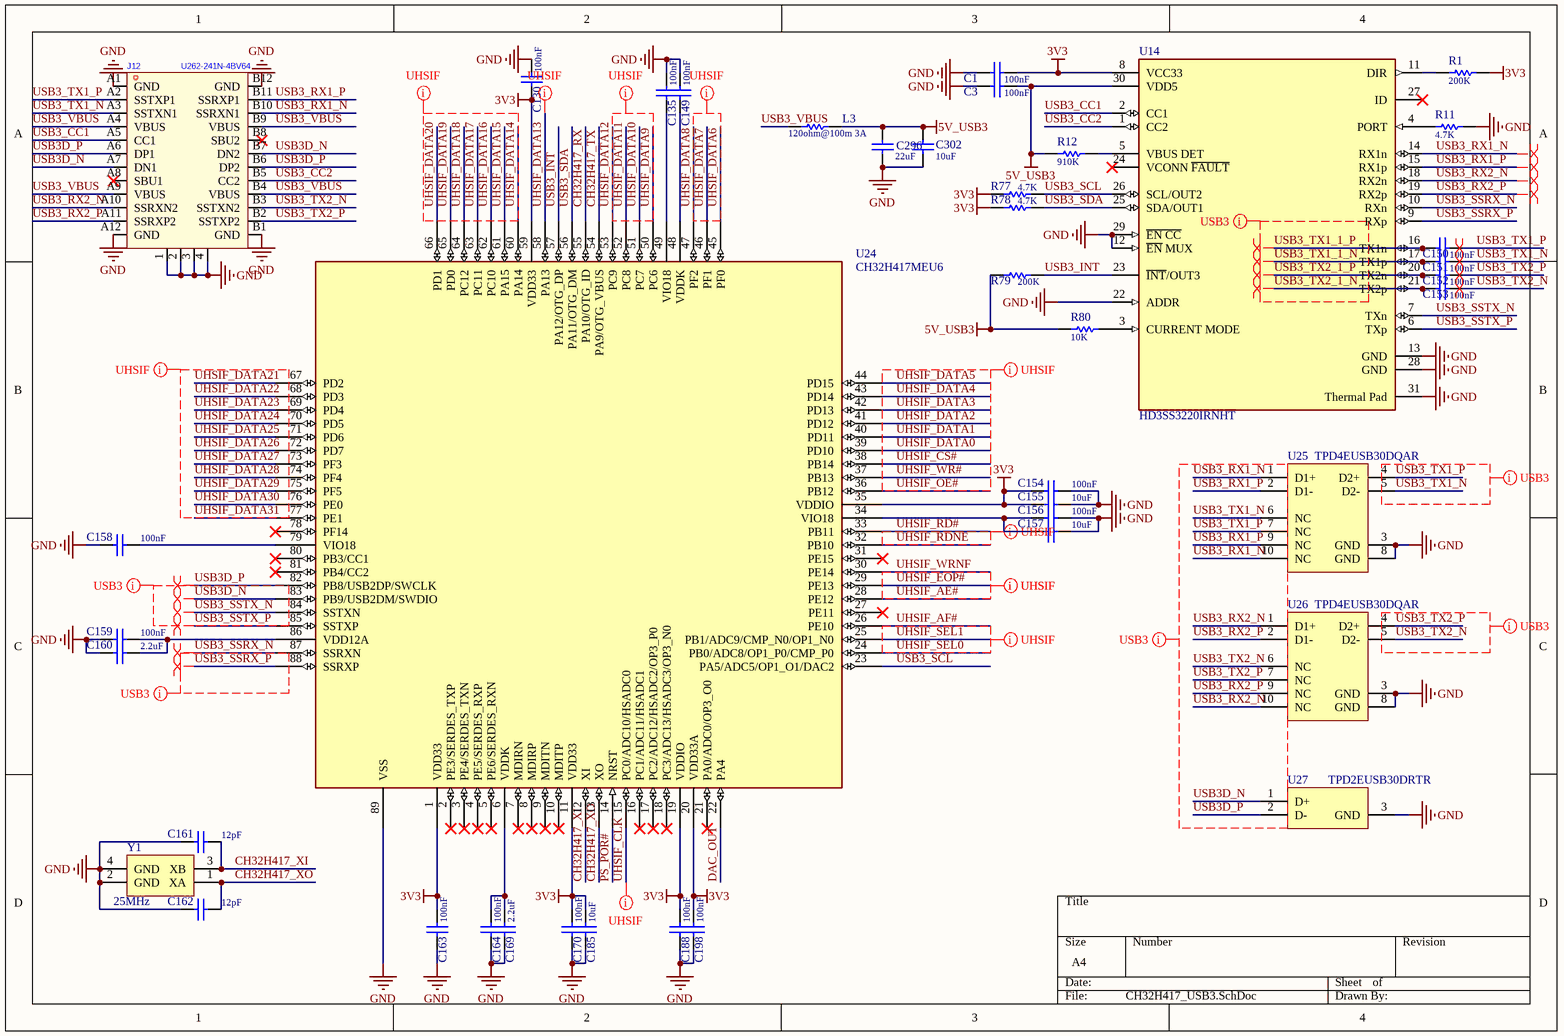
[diagram p10: CH32H417_USB3.SchDoc]

### Parts
C1  value 100nF  [C0402-L]  (hidden comment: Cap-S)
C3  value 100nF  [C0402-L]  (hidden comment: Cap-S)
C130  value 100nF  [C0402-L]  (hidden comment: Cap-S)
C135  value 100nF  [C0402-L]  (hidden comment: Cap-S)
C149  value 100nF  [C0402-L]  (hidden comment: Cap-S)
C150  value 100nF  [C0402-L]  (hidden comment: Cap-S)
C151  value 100nF  [C0402-L]  (hidden comment: Cap-S)
C152  value 100nF  [C0402-L]  (hidden comment: Cap-S)
C153  value 100nF  [C0402-L]  (hidden comment: Cap-S)
C154  value 100nF  [C0402-L]  (hidden comment: Cap-S)
C155  value 10uF  [C0603-M]  (hidden comment: Cap-S)
C156  value 100nF  [C0402-L]  (hidden comment: Cap-S)
C157  value 10uF  [C0603-M]  (hidden comment: Cap-S)
C158  value 100nF  [C0402-L]  (hidden comment: Cap-S)
C159  value 100nF  [C0402-L]  (hidden comment: Cap-S)
C160  value 2.2uF  [C0603-M]  (hidden comment: Cap-S)
C161  value 12pF  [C0402-L]  (hidden comment: Cap-S)
C162  value 12pF  [C0402-L]  (hidden comment: Cap-S)
C163  value 100nF  [C0402-L]  (hidden comment: Cap-S)
C164  value 100nF  [C0402-L]  (hidden comment: Cap-S)
C169  value 2.2uF  [C0603-M]  (hidden comment: Cap-S)
C170  value 100nF  [C0402-L]  (hidden comment: Cap-S)
C185  value 10uF  [C0603-M]  (hidden comment: Cap-S)
C188  value 100nF  [C0402-L]  (hidden comment: Cap-S)
C198  value 100nF  [C0402-L]  (hidden comment: Cap-S)
C296  value 22uF  [C0805-L]  (hidden comment: Cap-S)
C302  value 10uF  [C0603-L]  (hidden comment: Cap-S)
J12  U262-241N-4BV64  [USB-C-SMD_TYC-324G]
L3  value 120ohm@100m 3A  [R0805-L]  (hidden comment: R)
R1  value 200K  [R0402-L]  (hidden comment: R)
R11  value 4.7K  [R0402-L]  (hidden comment: R)
R12  value 910K  [R0402-L]  (hidden comment: R)
R77  value 4.7K  [R0402-L]  (hidden comment: R)
R78  value 4.7K  [R0402-L]  (hidden comment: R)
R79  value 200K  [R0402-L]  (hidden comment: R)
R80  value 10K  [R0402-L]  (hidden comment: R)
U14  HD3SS3220IRNHT  [FP-RNH0030A-IPC_C]
U24  CH32H417MEU6  [QFN-88_L10.0-W10.0-P0.40-BL-EP7.7]
U25  TPD4EUSB30DQAR  [DQA0010A_V]
U26  TPD4EUSB30DQAR  [DQA0010A_V]
U27  TPD2EUSB30DRTR  [DRT0003A]
Y1  25MHz  [CRYSTAL-SMD_4P-L2.0-W1.6-BL]

### Nets
3V3: C1.1 C130.1 C154.2 C155.2 C163.2 C170.2 C185.2 C188.2 C198.2 R1.1 R77.1 R78.1 U14.8(VCC33) U24.1(VDD33) U24.11(VDD33) U24.19(VDDIO) U24.20(VDD33A) U24.35(VDDIO) U24.59(VDD33)
5V_USB3: C3.1 C296.1 C302.1 L3.2 R12.2 R79.2 R80.1 U14.30(VDD5)
GND: C1.2 C3.2 C130.2 C135.2 C149.2 C154.1 C155.1 C156.1 C157.1 C158.2 C159.2 C160.2 C161.2 C162.2 C163.1 C164.1 C169.1 C170.1 C185.1 C188.1 C198.1 C296.2 C302.2 J12.1 J12.2 J12.3 J12.4 J12.A1(GND) J12.A12(GND) J12.B1(GND) J12.B12(GND) R11.2 U14.12(~{EN}_MUX) U14.13(GND) U14.22(ADDR) U14.28(GND) U14.29(~{EN_CC}) U14.31(Thermal_Pad) U24.89(VSS) U25.3(GND) U25.8(GND) U26.3(GND) U26.8(GND) U27.3(GND) Y1.2(GND) Y1.4(GND)
CH32H417_RX: U24.55(PA10/OTG_ID)
CH32H417_TX: U24.54(PA9/OTG_VBUS)
CH32H417_XI: C161.1 U24.12(XI) Y1.3(XB)
CH32H417_XO: C162.1 U24.13(XO) Y1.1(XA)
DAC_OUT: U24.22(PA4)
PS_POR#: U24.14(NRST)
UHSIF_AE#: U24.28(PE12)
UHSIF_AF#: U24.26(PE10)
UHSIF_CLK: U24.15(PC0/ADC10/HSADC0)
UHSIF_CS#: U24.38(PB14)
UHSIF_DATA0: U24.39(PD10)
UHSIF_DATA1: U24.40(PD11)
UHSIF_DATA2: U24.41(PD12)
UHSIF_DATA3: U24.42(PD13)
UHSIF_DATA4: U24.43(PD14)
UHSIF_DATA5: U24.44(PD15)
UHSIF_DATA6: U24.45(PF0)
UHSIF_DATA7: U24.46(PF1)
UHSIF_DATA8: U24.47(PF2)
UHSIF_DATA9: U24.50(PC6)
UHSIF_DATA10: U24.51(PC7)
UHSIF_DATA11: U24.52(PC8)
UHSIF_DATA12: U24.53(PC9)
UHSIF_DATA13: U24.58(PA13)
UHSIF_DATA14: U24.60(PA14)
UHSIF_DATA15: U24.61(PA15)
UHSIF_DATA16: U24.62(PC10)
UHSIF_DATA17: U24.63(PC11)
UHSIF_DATA18: U24.64(PC12)
UHSIF_DATA19: U24.65(PD0)
UHSIF_DATA20: U24.66(PD1)
UHSIF_DATA21: U24.67(PD2)
UHSIF_DATA22: U24.68(PD3)
UHSIF_DATA23: U24.69(PD4)
UHSIF_DATA24: U24.70(PD5)
UHSIF_DATA25: U24.71(PD6)
UHSIF_DATA26: U24.72(PD7)
UHSIF_DATA27: U24.73(PF3)
UHSIF_DATA28: U24.74(PF4)
UHSIF_DATA29: U24.75(PF5)
UHSIF_DATA30: U24.76(PE0)
UHSIF_DATA31: U24.77(PE1)
UHSIF_EOP#: U24.29(PE13)
UHSIF_OE#: U24.36(PB12)
UHSIF_RD#: U24.33(PB11)
UHSIF_RDNE: U24.32(PB10)
UHSIF_SEL0: U24.24(PB0/ADC8/OP1_P0/CMP_P0)
UHSIF_SEL1: U24.25(PB1/ADC9/CMP_N0/OP1_N0)
UHSIF_WR#: U24.37(PB13)
UHSIF_WRNF: U24.30(PE14)
USB3_CC1: J12.A5(CC1) U14.2(CC1)
USB3_CC2: J12.B5(CC2) U14.1(CC2)
USB3_INT: R79.1 U14.23(~{INT}/OUT3) U24.57(PA12/OTG_DP)
USB3_RX1_N: J12.B10(SSRXN1) U14.14(RX1n) U25.1(D1+) U25.10(NC)
USB3_RX1_P: J12.B11(SSRXP1) U14.15(RX1p) U25.2(D1-) U25.9(NC)
USB3_RX2_N: J12.A10(SSRXN2) U14.18(RX2n) U26.1(D1+) U26.10(NC)
USB3_RX2_P: J12.A11(SSRXP2) U14.19(RX2p) U26.2(D1-) U26.9(NC)
USB3_SCL: R77.2 U14.26(SCL/OUT2) U24.23(PA5/ADC5/OP1_O1/DAC2)
USB3_SDA: R78.2 U14.25(SDA/OUT1) U24.56(PA11/OTG_DM)
USB3_SSRX_N: U14.10(RXn) U24.87(SSRXN)
USB3_SSRX_P: U14.9(RXp) U24.88(SSRXP)
USB3_SSTX_N: U14.7(TXn) U24.84(SSTXN)
USB3_SSTX_P: U14.6(TXp) U24.85(SSTXP)
USB3_TX1_1_N: C151.2 U14.17(TX1p)
USB3_TX1_1_P: C150.2 U14.16(TX1n)
USB3_TX1_N: C151.1 J12.A3(SSTXN1) U25.5(D2-) U25.6(NC)
USB3_TX1_P: C150.1 J12.A2(SSTXP1) U25.4(D2+) U25.7(NC)
USB3_TX2_1_N: C153.2 U14.21(TX2p)
USB3_TX2_1_P: C152.2 U14.20(TX2n)
USB3_TX2_N: C153.1 J12.B3(SSTXN2) U26.5(D2-) U26.6(NC)
USB3_TX2_P: C152.1 J12.B2(SSTXP2) U26.4(D2+) U26.7(NC)
USB3_VBUS: J12.A4(VBUS) J12.A9(VBUS) J12.B4(VBUS) J12.B9(VBUS) L3.1
USB3D_N: J12.A7(DN1) J12.B7(DN2) U24.83(PB9/USB2DM/SWDIO) U27.1(D+)
USB3D_P: J12.A6(DP1) J12.B6(DP2) U24.82(PB8/USB2DP/SWCLK) U27.2(D-)
NetC135_1: C135.1 U24.49(VIO18)
NetC149_1: C149.1 U24.48(VDDK)
NetC156_2: C156.2 C157.2 U24.34(VIO18)
NetC158_1: C158.1 U24.79(VIO18)
NetC159_1: C159.1 C160.1 U24.86(VDD12A)
NetC164_2: C164.2 C169.2 U24.6(VDDK)
NetR1_2: R1.2 U14.11(DIR)
NetR11_1: R11.1 U14.4(PORT)
NetR12_1: R12.1 U14.5(VBUS_DET)
NetR80_2: R80.2 U14.3(CURRENT_MODE)

Not connected (* = marked no-connect by the designer): J12 A8(SBU1)* B8(SBU2)*; U14 24(VCONN_~{FAULT})* 27(ID)*; U24 2(PE3/SERDES_TXP)* 3(PE4/SERDES_TXN)* 4(PE5/SERDES_RXP)* 5(PE6/SERDES_RXN)* 7(MDIRN)* 8(MDIRP)* 9(MDITN)* 10(MDITP)* 16(PC1/ADC11/HSADC1)* 17(PC2/ADC12/HSADC2/OP3_P0)* 18(PC3/ADC13/HSADC3/OP3_N0)* 21(PA0/ADC0/OP3_O0)* 27(PE11)* 31(PE15)* 78(PF14)* 80(PB3/CC1)* 81(PB4/CC2)*

### Layout directives
differential pair: USB3_RX1_N, USB3_RX1_P, USB3_RX2_N, USB3_RX2_P, USB3_SSRX_N, USB3_SSRX_P, USB3_SSTX_N, USB3_SSTX_P, USB3_TX1_1_N, USB3_TX1_1_P, USB3_TX1_N, USB3_TX1_P, USB3_TX2_1_N, USB3_TX2_1_P, USB3_TX2_N, USB3_TX2_P, USB3D_N, USB3D_P
net class UHSIF: UHSIF_CLK, UHSIF_CS#, UHSIF_DATA0, UHSIF_DATA1, UHSIF_DATA2, UHSIF_DATA3, UHSIF_DATA4, UHSIF_DATA5, UHSIF_DATA6, UHSIF_DATA7, UHSIF_DATA8, UHSIF_DATA9, UHSIF_DATA10, UHSIF_DATA11, UHSIF_DATA12, UHSIF_DATA13, UHSIF_DATA14, UHSIF_DATA15, UHSIF_DATA16, UHSIF_DATA17, UHSIF_DATA18, UHSIF_DATA19, UHSIF_DATA20, UHSIF_DATA21, UHSIF_DATA22, UHSIF_DATA23, UHSIF_DATA24, UHSIF_DATA25, UHSIF_DATA26, UHSIF_DATA27, UHSIF_DATA28, UHSIF_DATA29, UHSIF_DATA30, UHSIF_DATA31, UHSIF_EOP#, UHSIF_OE#, UHSIF_RD#, UHSIF_SEL1, UHSIF_WR#
net class USB3: USB3_RX1_N, USB3_RX1_P, USB3_RX2_N, USB3_RX2_P, USB3_SSRX_N, USB3_SSRX_P, USB3_SSTX_N, USB3_SSTX_P, USB3_TX1_1_N, USB3_TX1_1_P, USB3_TX1_N, USB3_TX1_P, USB3_TX2_1_N, USB3_TX2_1_P, USB3_TX2_N, USB3_TX2_P, USB3D_N, USB3D_P

### Library data of the parts
C1 C3 C130 C135 C149-C164 C169 C170 C185 C188 C198 C296 C302 = Cap-S: 贴片瓷片电容
J12 = TYPE-C-USB3: USB3.0的typec接口; Manufacturer: XKB Connection(中国星坤); Add into BOM: yes; Connector Type: Type-C; Gender: 母; Number of Contacts: 24P; Number of Ports: 1; Current Rating - Power (Max): 5A; Soldering Temperature(Max): 260℃; Symbol: U262-241N-4BV64; Device: U262-241N-4BV64; LCSC Part Name: Type-C 母; Supplier Part: C388660; Manufacturer Part: U262-241N-4BV64; Supplier Footprint: SMD; JLCPCB Part Class: Extended Part; Datasheet: https://atta.szlcsc.com/upload/public/pdf/source/20211015/8B22A47B12BDC5CD319611427B3C1C1B.pdf; Supplier: LCSC; Convert to PCB: yes; Standard: -; Mounting Style: -; Contact Material: 高导铜; Contact Plating: 金; Operating Temperature Range: -40℃~+85℃
L3 R1 R11 R12 R77-R80 = Res: 贴片电阻
U14 = CMP-04877-000019-1: USB TYPE-C DRP PORT CONTROLLER W; Max Supply Voltage: 5.5V; Min Supply Voltage: 3V; Number of Ports: 1; Data Rate: 10Gbps; USB Standard: USB 3.1; Mount: Surface Mount; Max Operating Temperature: 70°C; Lead Free: Lead Free; RoHS Compliant: Yes; Packaging: Tape and Reel; Number of Pins: 30; Min Operating Temperature: 0°C; REACH SVHC: No SVHC
U24 = CH32H417MEU6: RISC-V FPU HD-MCU, 384MHz, USB3.0 & PD, 100M Ethernet, DVP, QSPI, OPA, ADC, DAC
U25 U26 = CMP-0326-00027-3: ESD Solution for Super-Speed (6 GBPS) USB 3.0 Interface, 4 Channels, -40 to +85 degC, 10-pin SON (DQA), Green (RoHS & no Sb/Br); Manufacturer: Texas Instruments; Differential Capacitance(pF): 0.05; Serial ATA / eSATA: TRUE; IO Capacitance(Typ)(pF): 0.8; IO Leakage Current(nA): 10; IEC 61000-4-2 Air-Gap(+/- kV): 8; ComponentLink3Description: URL Link1; PartNumber: TPD4EUSB30DQAR; DatasheetVersion: SLVSAC2C; ComponentLink2URL: http://www.ti.com/general/docs/lit/getliterature.tsp?genericPartNumber=TPD4EUSB30&fileType=pdf; USB Super Speed: TRUE; Eco-Plan: Green (RoHS & no Sb/Br); Mounting Technology: Surface Mount; 1394 / Firewire: TRUE; PackageVersion: revB, Sep-2009; SubFamily: ESD Solution; USB Full Speed: TRUE; USB High Speed: TRUE; ComponentLink2Description: Datasheet; ComponentLink1URL: http://www.ti.com/; IEC 61000-4-2 Contact(+/- kV): 8; Breakdown Voltage(Min)(V): 8; PackageReference: DQA0010A; ComponentLink1Description: Manufacturer URL; PackageDescription: 10-Pin Plastic Small Outline No-Lead, 1 x 2.5 x 0.55 mm Body, 0.5 mm Pitch; ComponentLink3URL: SamplesURL:http://www.ti.com/product/tpd4eusb30#samples; HDMI: TRUE
U27 = CMP-0326-00046-3: ESD Solution for Super-Speed (6 Gbps) USB 3.0 Interface, 2 Channels, -40 to +85 degC, 3-pin SOT (DRT), Green (Rohs & No Sb/Br); Manufacturer: Texas Instruments; Differential Capacitance(pF): 0.01; Breakdown Voltage(Min)(V): 9; HDMI: TRUE; IEC 61000-4-2 Air-Gap(+/- kV): 8; IO Leakage Current(nA): 10; IO Capacitance(Typ)(pF): 0.7; Mounting Technology: Surface Mount; PackageDescription: 3-Flat Lead Plastic Small Outline, 1 x 1 mm (inc leads), 0.35 mm Pitch; IEC 61000-4-2 Contact(+/- kV): 8; USB Super Speed: TRUE; Eco-Plan: Green (RoHS & no Sb/Br); USB High Speed: TRUE; PackageReference: DRT0003A; SubFamily: ESD Solution; USB Full Speed: TRUE; ComponentLink1Description: Datasheet; ComponentLink2URL: SamplesURL:http://www.ti.com/product/tpd2eusb30#samples; PackageVersion: revD, Jun-2008; ComponentLink2Description: URL Link1; 1394 / Firewire: TRUE; PartNumber: TPD2EUSB30DRTR; ComponentLink1URL: http://www.ti.com/general/docs/lit/getliterature.tsp?genericPartNumber=TPD2EUSB30&fileType=pdf; DatasheetVersion: SLVSAC2C; Serial ATA / eSATA: TRUE
Y1 = XTAL-PASS